# Altium schematic sheet a0206-2006.17.SchDoc
size 558 x 431 mm
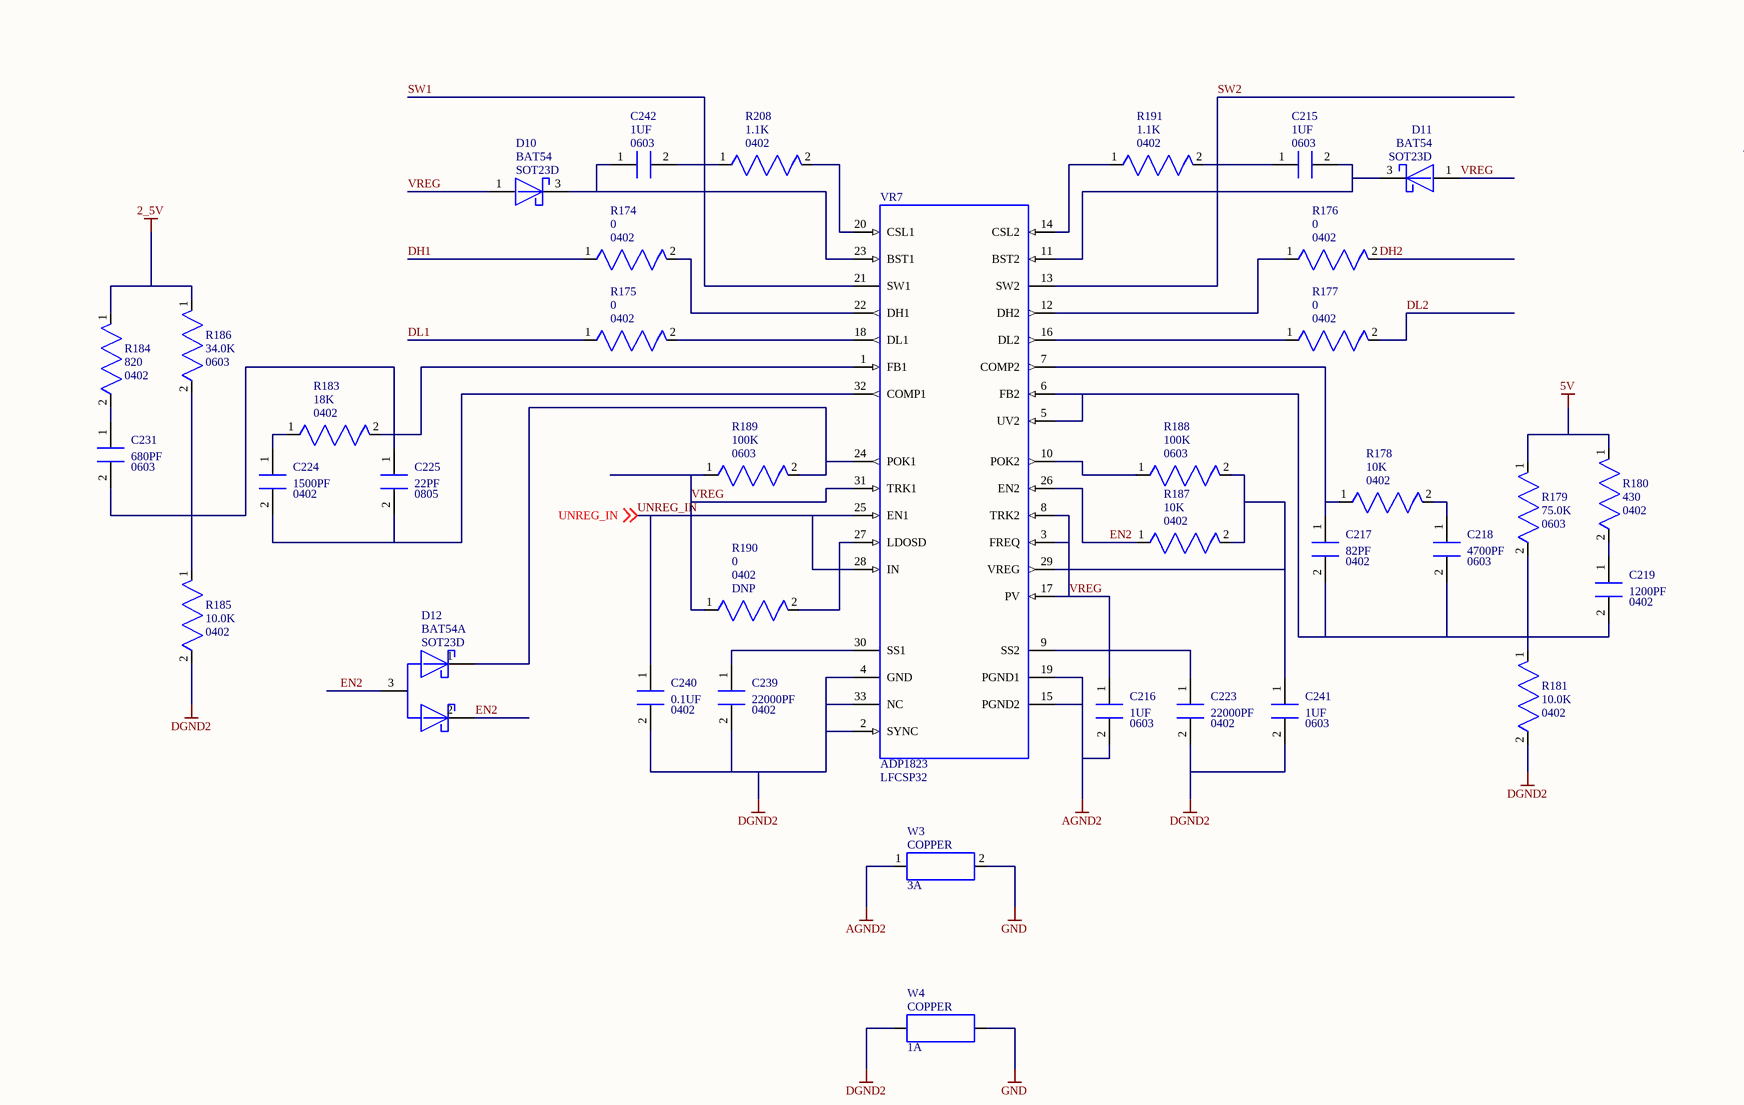
[diagram p0: a0206-2006.17.SchDoc, top left]
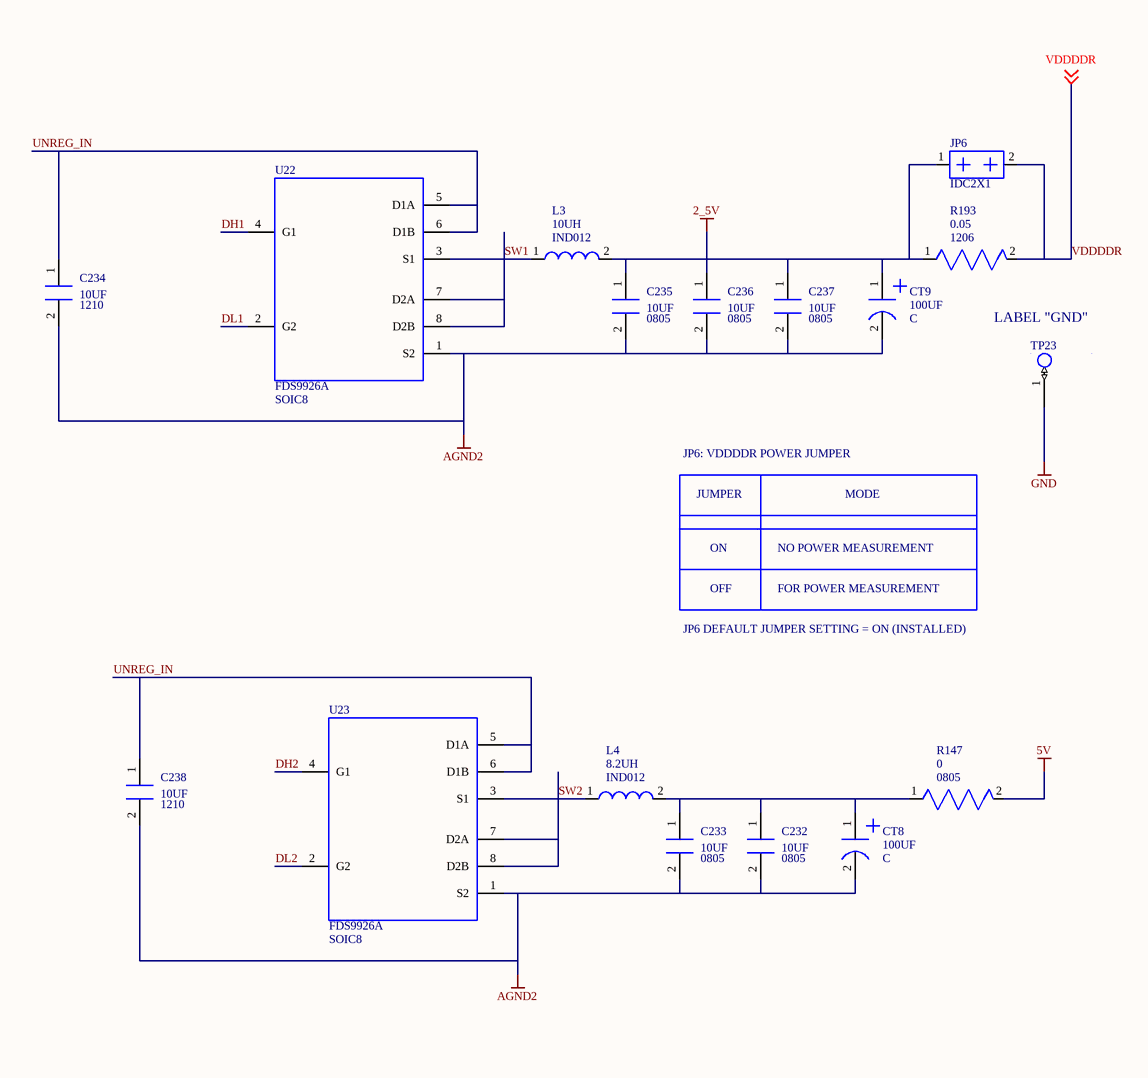
[diagram p1: a0206-2006.17.SchDoc, top right]
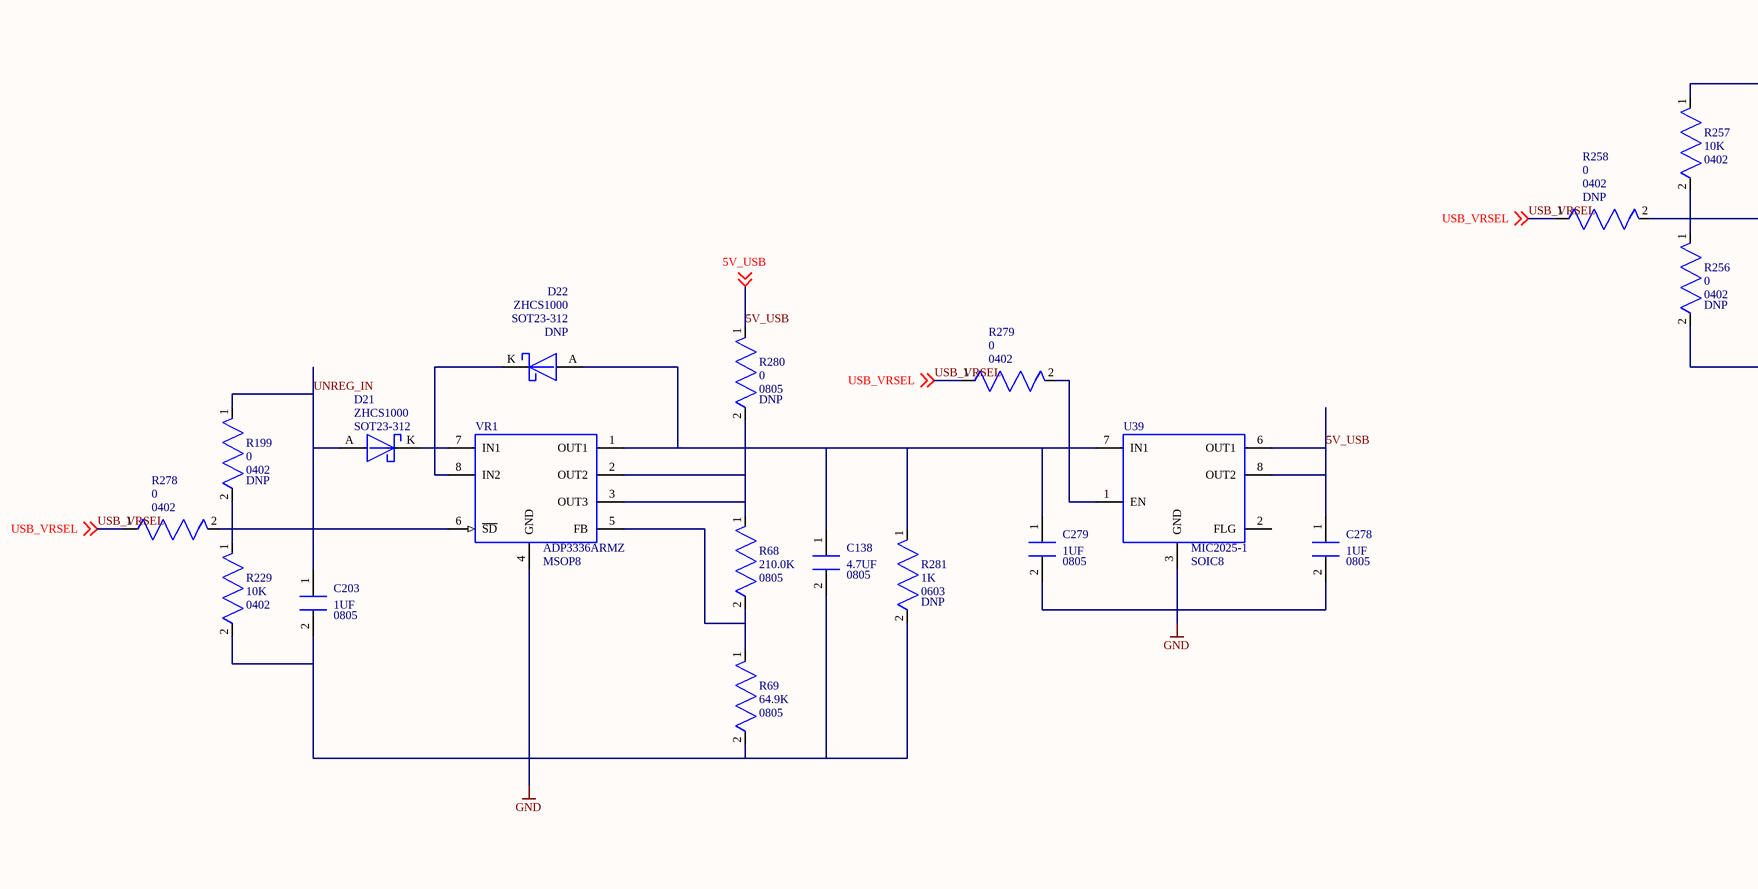
[diagram p2: a0206-2006.17.SchDoc, bottom left]
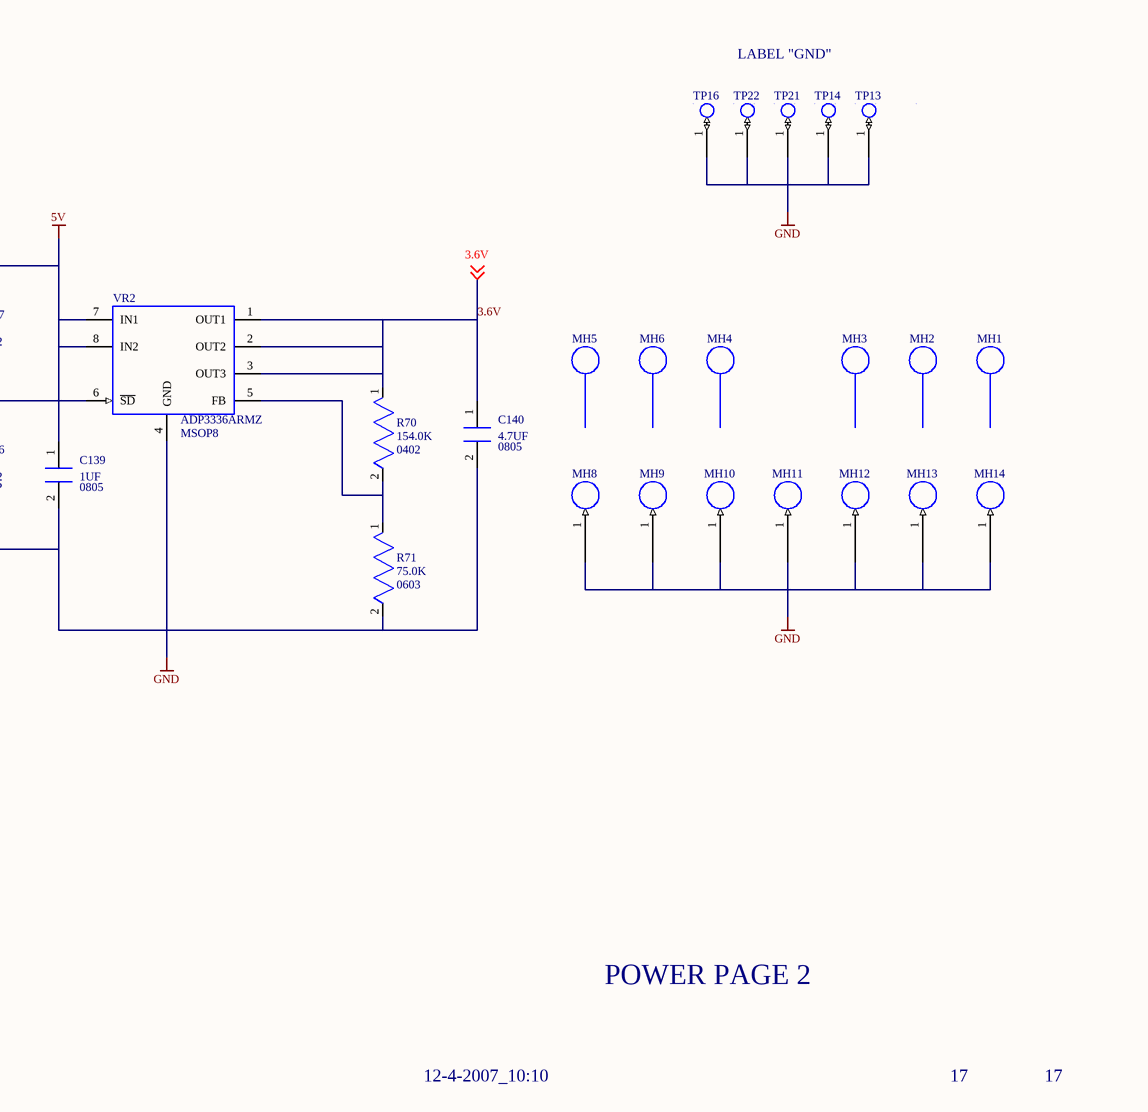
[diagram p3: a0206-2006.17.SchDoc, bottom right]

## Parts
C138  value 4.7UF  [0805]  (hidden comment: *)
C139  value 1UF  [0805]  (hidden comment: *)
C140  value 4.7UF  [0805]  (hidden comment: *)
C203  value 1UF  [0805]  (hidden comment: *)
C215  value 1UF  [0603]  (hidden comment: *)
C216  value 1UF  [0603]  (hidden comment: *)
C217  value 82PF  [0402]  (hidden comment: *)
C218  value 4700PF  [0603]  (hidden comment: *)
C219  value 1200PF  [0402]  (hidden comment: *)
C223  value 22000PF  [0402]  (hidden comment: *)
C224  value 1500PF  [0402]  (hidden comment: *)
C225  value 22PF  [0805]  (hidden comment: *)
C231  value 680PF  [0603]  (hidden comment: *)
C232  value 10UF  [0805]  (hidden comment: *)
C233  value 10UF  [0805]  (hidden comment: *)
C234  value 10UF  [1210]  (hidden comment: *)
C235  value 10UF  [0805]  (hidden comment: *)
C236  value 10UF  [0805]  (hidden comment: *)
C237  value 10UF  [0805]  (hidden comment: *)
C238  value 10UF  [1210]  (hidden comment: *)
C239  value 22000PF  [0402]  (hidden comment: *)
C240  value 0.1UF  [0402]  (hidden comment: *)
C241  value 1UF  [0603]  (hidden comment: *)
C242  value 1UF  [0603]  (hidden comment: *)
C278  value 1UF  [0805]  (hidden comment: *)
C279  value 1UF  [0805]  (hidden comment: *)
CT8  value 100UF  [C]  (hidden comment: *)
CT9  value 100UF  [C]  (hidden comment: *)
D10  PART: BAT54  [SOT23D]  (hidden comment: *)
D11  PART: BAT54  [SOT23D]  (hidden comment: *)
D12  PART: BAT54A  [SOT23D]  (hidden comment: *)
D21  PART: ZHCS1000  [SOT23-312]  (hidden comment: *)
D22  PART: ZHCS1000  CLASS: DNP  [SOT23-312]  (hidden comment: *)
JP6  *  [IDC2X1]  (value not drawn)
L3  value 10UH  [IND012]  (hidden comment: *)
L4  value 8.2UH  [IND012]  (hidden comment: *)
MH1  *  [MSC004]  (value not drawn)
MH2  *  [MSC004]  (value not drawn)
MH3  *  [MSC004]  (value not drawn)
MH4  *  [MSC004]  (value not drawn)
MH5  *  [MSC004]  (value not drawn)
MH6  *  [MSC004]  (value not drawn)
MH8  *  [MSC006]  (value not drawn)
MH9  *  [MSC006]  (value not drawn)
MH10  *  [MSC006]  (value not drawn)
MH11  *  [MSC006]  (value not drawn)
MH12  *  [MSC006]  (value not drawn)
MH13  *  [MSC006]  (value not drawn)
MH14  *  [MSC006]  (value not drawn)
R68  value 210.0K  [0805]  (hidden comment: *)
R69  value 64.9K  [0805]  (hidden comment: *)
R70  value 154.0K  [0402]  (hidden comment: *)
R71  value 75.0K  [0603]  (hidden comment: *)
R147  value 0  [0805]  (hidden comment: *)
R174  value 0  [0402]  (hidden comment: *)
R175  value 0  [0402]  (hidden comment: *)
R176  value 0  [0402]  (hidden comment: *)
R177  value 0  [0402]  (hidden comment: *)
R178  value 10K  [0402]  (hidden comment: *)
R179  value 75.0K  [0603]  (hidden comment: *)
R180  value 430  [0402]  (hidden comment: *)
R181  value 10.0K  [0402]  (hidden comment: *)
R183  value 18K  [0402]  (hidden comment: *)
R184  value 820  [0402]  (hidden comment: *)
R185  value 10.0K  [0402]  (hidden comment: *)
R186  value 34.0K  [0603]  (hidden comment: *)
R187  value 10K  [0402]  (hidden comment: *)
R188  value 100K  [0603]  (hidden comment: *)
R189  value 100K  [0603]  (hidden comment: *)
R190  value 0  CLASS: DNP  [0402]  (hidden comment: *)
R191  value 1.1K  [0402]  (hidden comment: *)
R193  value 0.05  [1206]  (hidden comment: *)
R199  value 0  CLASS: DNP  [0402]  (hidden comment: *)
R208  value 1.1K  [0402]  (hidden comment: *)
R229  value 10K  [0402]  (hidden comment: *)
R256  value 0  CLASS: DNP  [0402]  (hidden comment: *)
R257  value 10K  [0402]  (hidden comment: *)
R258  value 0  CLASS: DNP  [0402]  (hidden comment: *)
R278  value 0  [0402]  (hidden comment: *)
R279  value 0  [0402]  (hidden comment: *)
R280  value 0  CLASS: DNP  [0805]  (hidden comment: *)
R281  value 1K  CLASS: DNP  [0603]  (hidden comment: *)
TP13  *  [TP]  (value not drawn)
TP14  *  [TP]  (value not drawn)
TP16  *  [TP]  (value not drawn)
TP21  *  [TP]  (value not drawn)
TP22  *  [TP]  (value not drawn)
TP23  *  [TP]  (value not drawn)
U22  PART: FDS9926A  [SOIC8]  (hidden comment: *)
U23  PART: FDS9926A  [SOIC8]  (hidden comment: *)
U39  PART: MIC2025-1  [SOIC8]  (hidden comment: *)
VR1  PART: ADP3336ARMZ  [MSOP8]  (hidden comment: *)
VR2  PART: ADP3336ARMZ  [MSOP8]  (hidden comment: *)
VR7  PART: ADP1823  [LFCSP32]  (hidden comment: *)
W3  value COPPER  [3A]  (hidden comment: *)
W4  value COPPER  [1A]  (hidden comment: *)

## Nets
2_5V: C235.1(A) C236.1(A) C237.1(A) CT9.1(P) JP6.1 L3.2(B) R184.1(N1) R186.1(N1) R193.1(N1)
5V: C139.1(A) R147.2(N2) R179.1(N1) R180.1(N1) R257.1(N1) VR2.7(IN1) VR2.8(IN2)
AGND2: C216.2(B) C232.2(B) C233.2(B) C234.2(B) C235.2(B) C236.2(B) C237.2(B) C238.2(B) CT8.2(N) CT9.2(N) U22.1(S2) U23.1(S2) VR7.15(PGND2) VR7.19(PGND1) W3.1(N1)
DGND2: C223.2(B) C239.2(B) C240.2(B) C241.2(B) R181.2(N2) R185.2(N2) VR7.2(SYNC) VR7.4(GND) VR7.33(NC) W4.1(N1)
GND: C138.2(B) C139.2(B) C140.2(B) C203.2(B) C278.2(B) C279.2(B) MH8.1(TP) MH9.1(TP) MH10.1(TP) MH11.1(TP) MH12.1(TP) MH13.1(TP) MH14.1(TP) R69.2(N2) R71.2(N2) R229.2(N2) R256.2(N2) R281.2(N2) TP13.1(TP) TP14.1(TP) TP16.1(TP) TP21.1(TP) TP22.1(TP) TP23.1(TP) U39.3(GND) VR1.4(GND) VR2.4(GND) W3.2(N2) W4.2(N2)
3.6V: C140.1(A) R70.1(N1) VR2.1(OUT1) VR2.2(OUT2) VR2.3(OUT3) ; off-sheet 3.6V
5V_USB: C278.1(A) R280.1(N1) U39.6(OUT1) U39.8(OUT2) ; off-sheet 5V_USB
DH1: R174.1(N1) U22.4(G1)
DH2: R176.2(N2) U23.4(G1)
DL1: R175.1(N1) U22.2(G2)
DL2: R177.2(N2) U23.2(G2)
EN2: D12.2(CATHODE_B) D12.3(ANODE) R187.1(N1) VR7.26(EN2)
SW1: C242.2(B) L3.1(A) R208.1(N1) U22.3(S1) U22.7(D2A) U22.8(D2B) VR7.21(SW1)
SW2: C215.1(A) L4.1(A) R191.2(N2) U23.3(S1) U23.7(D2A) U23.8(D2B) VR7.13(SW2)
UNREG_IN: C203.1(A) C234.1(A) C238.1(A) C240.1(A) D21.A(ANODE) R199.1(N1) U22.5(D1A) U22.6(D1B) U23.5(D1A) U23.6(D1B) VR7.25(EN1) VR7.28(IN) ; off-sheet UNREG_IN
USB_VRSEL: R258.1(N1) R278.1(N1) R279.1(N1) ; off-sheet USB_VRSEL
VDDDDR: JP6.2 R193.2(N2) ; off-sheet VDDDDR
VREG: C216.1(A) C241.1(A) D10.1(ANODE) D11.1(ANODE) R187.2(N2) R188.2(N2) R189.1(N1) R190.1(N1) VR7.3(FREQ) VR7.8(TRK2) VR7.17(PV) VR7.29(VREG) VR7.31(TRK1)
NetC138_1: C138.1(A) C279.1(A) D22.A(ANODE) R68.1(N1) R280.2(N2) R281.1(N1) U39.7(IN1) VR1.1(OUT1) VR1.2(OUT2) VR1.3(OUT3)
NetC215_2: C215.2(B) D11.3(CATHODE) VR7.11(BST2)
NetC217_1: C217.1(A) R178.1(N1) VR7.7(COMP2)
NetC217_2: C217.2(B) C218.2(B) C219.2(B) R179.2(N2) R181.1(N1) VR7.5(UV2) VR7.6(FB2)
NetC218_1: C218.1(A) R178.2(N2)
NetC219_1: C219.1(A) R180.2(N2)
NetC223_1: C223.1(A) VR7.9(SS2)
NetC224_1: C224.1(A) R183.1(N1)
NetC224_2: C224.2(B) C225.2(B) VR7.32(COMP1)
NetC225_1: C225.1(A) C231.2(B) R183.2(N2) R185.1(N1) R186.2(N2) VR7.1(FB1)
NetC231_1: C231.1(A) R184.2(N2)
NetC232_1: C232.1(A) C233.1(A) CT8.1(P) L4.2(B) R147.1(N1)
NetC239_1: C239.1(A) VR7.30(SS1)
NetC242_1: C242.1(A) D10.3(CATHODE) VR7.23(BST1)
NetD12_1: D12.1(CATHODE_A) R189.2(N2) VR7.24(POK1)
NetD21_K: D21.K(CATHODE) D22.K(CATHODE) VR1.7(IN1) VR1.8(IN2)
NetR68_2: R68.2(N2) R69.1(N1) VR1.5(FB)
NetR70_2: R70.2(N2) R71.1(N1) VR2.5(FB)
NetR174_2: R174.2(N2) VR7.22(DH1)
NetR175_2: R175.2(N2) VR7.18(DL1)
NetR176_1: R176.1(N1) VR7.12(DH2)
NetR177_1: R177.1(N1) VR7.16(DL2)
NetR188_1: R188.1(N1) VR7.10(POK2)
NetR190_2: R190.2(N2) VR7.27(LDOSD)
NetR191_1: R191.1(N1) VR7.14(CSL2)
NetR199_2: R199.2(N2) R229.1(N1) R278.2(N2) VR1.6(~{SD})
NetR208_2: R208.2(N2) VR7.20(CSL1)
NetR256_1: R256.1(N1) R257.2(N2) R258.2(N2) VR2.6(~{SD})
NetR279_2: R279.2(N2) U39.1(EN)

Not connected (* = marked no-connect by the designer): D10 2; D11 2; MH1 1; MH2 1; MH3 1; MH4 1; MH5 1; MH6 1; U39 2(FLG) 4 5

## Notes on the sheet
- LABEL "GND"
- JP6: VDDDDR POWER JUMPER
- JUMPER
- ON
- NO POWER MEASUREMENT
- MODE
- OFF
- FOR POWER MEASUREMENT
- JP6 DEFAULT JUMPER SETTING = ON (INSTALLED)
- POWER PAGE 2
- 12-4-2007_10:10
- 17
- A
- B
- C
- D
- 1
- 2
- 3
- 20 Cotton Road
- 4
- DEVICES
- ANALOG
- Nashua, NH 03063
- PH: 1-800-ANALOGD
- Title
- ADSP-BF548 EZ-KIT LITE
- Size
- Board No.
- A0206-2006
- Rev
- 1.4B
- Date
- Sheet
- of

## Library data of the parts
C138 = CAP_NON_POLARIZED.2: PART_SPEC: CAPACITOR; LEVEL: STD; PRT_NUM: 7000275; VOLTAGE: 6.3V; TOLERANCE: 10%; TYPE: X5R; PKG_TYPE: 0805; ROHS: ROHS
C139 C278 = CAP_NON_POLARIZED.2: PART_SPEC: CAPACITOR; LEVEL: STD; TYPE: X7R; TOLERANCE: 10%; VOLTAGE: 16V; PRT_NUM: 7000143; PKG_TYPE: 0805; ROHS: ROHS
C140 = CAP_NON_POLARIZED.2: PART_SPEC: CAPACITOR; LEVEL: STD; TYPE: X5R; TOLERANCE: 10%; VOLTAGE: 6.3V; PRT_NUM: 7000275; PKG_TYPE: 0805; ROHS: ROHS
C203 C279 = CAP_NON_POLARIZED.2: PART_SPEC: CAPACITOR; LEVEL: STD; PRT_NUM: 7000143; VOLTAGE: 16V; TOLERANCE: 10%; TYPE: X7R; PKG_TYPE: 0805; ROHS: ROHS
C215 C242 = CAP_NON_POLARIZED.1: PART_SPEC: CAPACITOR; LEVEL: STD; PRT_NUM: 7000344; TYPE: X5R; VOLTAGE: 16V; TOLERANCE: 10%; PKG_TYPE: 0603; ROHS: ROHS
C216 = CAP_NON_POLARIZED.2: PART_SPEC: CAPACITOR; LEVEL: STD; TOLERANCE: 10%; VOLTAGE: 16V; TYPE: X5R; PRT_NUM: 7000344; PKG_TYPE: 0603; ROHS: ROHS
C217 = CAP_NON_POLARIZED.2: PART_SPEC: CAPACITOR; LEVEL: STD; PRT_NUM: 7000548; TYPE: NPO; VOLTAGE: 50V; TOLERANCE: 5%; PKG_TYPE: 0402; ROHS: ROHS
C218 = CAP_NON_POLARIZED.2: PART_SPEC: CAPACITOR; LEVEL: STD; PRT_NUM: 7000387; TYPE: X7R; VOLTAGE: 16V; TOLERANCE: 10%; PKG_TYPE: 0603; ROHS: ROHS
C219 = CAP_NON_POLARIZED.2: PART_SPEC: CAPACITOR; LEVEL: STD; PRT_NUM: 7000546; TYPE: X7R; VOLTAGE: 50V; TOLERANCE: 10%; PKG_TYPE: 0402; ROHS: ROHS
C223 C239 = CAP_NON_POLARIZED.2: PART_SPEC: CAPACITOR; LEVEL: STD; PRT_NUM: 7000549; TYPE: X7R; VOLTAGE: 25V; TOLERANCE: 10%; PKG_TYPE: 0402; ROHS: ROHS
C224 = CAP_NON_POLARIZED.2: PART_SPEC: CAPACITOR; LEVEL: STD; PRT_NUM: 7000550; TYPE: X7R; VOLTAGE: 50V; TOLERANCE: 10%; PKG_TYPE: 0402; ROHS: ROHS
C225 = CAP_NON_POLARIZED.2: PART_SPEC: CAPACITOR; LEVEL: STD; PRT_NUM: 7000028; TYPE: NPO; VOLTAGE: 50V; TOLERANCE: 5%; PKG_TYPE: 0805; ROHS: ROHS
C231 = CAP_NON_POLARIZED.2: PART_SPEC: CAPACITOR; LEVEL: STD; PRT_NUM: 7000413; TYPE: NPO; VOLTAGE: 50V; TOLERANCE: 5%; PKG_TYPE: 0603; ROHS: ROHS
C232 C236 = CAP_NON_POLARIZED.2: PART_SPEC: CAPACITOR; LEVEL: STD; TOLERANCE: 10%; VOLTAGE: 6.3V; TYPE: X5R; PRT_NUM: 7000265; PKG_TYPE: 0805; ROHS: ROHS
C233 C235 C237 = CAP_NON_POLARIZED.2: PART_SPEC: CAPACITOR; LEVEL: STD; PRT_NUM: 7000265; TYPE: X5R; VOLTAGE: 6.3V; TOLERANCE: 10%; PKG_TYPE: 0805; ROHS: ROHS
C234 = CAP_NON_POLARIZED.2: PART_SPEC: CAPACITOR; LEVEL: STD; PRT_NUM: 7000492; TYPE: X5R; VOLTAGE: 16V; TOLERANCE: 10%; PKG_TYPE: 1210; ROHS: ROHS
C238 = CAP_NON_POLARIZED.2: PART_SPEC: CAPACITOR; LEVEL: STD; TOLERANCE: 10%; VOLTAGE: 16V; TYPE: X5R; PRT_NUM: 7000492; PKG_TYPE: 1210; ROHS: ROHS
C240 = CAP_NON_POLARIZED.2: PART_SPEC: CAPACITOR; LEVEL: STD; PRT_NUM: 7000278; TYPE: X5R; VOLTAGE: 10V; TOLERANCE: 10%; PKG_TYPE: 0402; ROHS: ROHS
C241 = CAP_NON_POLARIZED.2: PART_SPEC: CAPACITOR; LEVEL: STD; PRT_NUM: 7000344; TYPE: X5R; VOLTAGE: 16V; TOLERANCE: 10%; PKG_TYPE: 0603; ROHS: ROHS
CT8 = CAP_POLARIZED.3: PART_SPEC: CAPACITOR; LEVEL: STD; PRT_NUM: 7000303; VOLTAGE: 10V; TOLERANCE: 10%; PKG_TYPE: C; TYPE: TANT-LOW-ESR; ROHS: ROHS
CT9 = CAP_POLARIZED.3: PART_SPEC: CAPACITOR; LEVEL: STD; TOLERANCE: 10%; VOLTAGE: 10V; PRT_NUM: 7000303; PKG_TYPE: C; ROHS: ROHS; TYPE: TANT-LOW-ESR
D10 D11 = DIO_SCHOTTYKY_BAT54.1: SCHOTTKY 30V SINGLE; LEVEL: STD; CURRENT: 200MA; NC: 2; PRT_NUM: 7000534; PKG_TYPE: SOT23D; ROHS: ROHS; WEB: http://www.fairchildsemi.com/pf/BA/BAT54.html
D12 = DIO_SCHOTTYKY_BAT54A.1: SCHOTTKY 30V DUAL; LEVEL: STD; CURRENT: 200MA; PRT_NUM: 7000533; PKG_TYPE: SOT23D; ROHS: ROHS; WEB: http://www.fairchildsemi.com/pf/BA/BAT54A.html
D21 D22 = DIO_SCHOTTKY_3.3: SCHOTTKY; LEVEL: STD; CURRENT: 1A; PRT_NUM: 7000252; PKG_TYPE: SOT23-312; WEB: http://www.zetex.com/3.0/3-3-3.asp?pn; ROHS: ROHS
JP6 = CON_2X1.2: HEADER; PART_SPEC: CONNECTOR; LEVEL: STD; PRT_NUM: 6000774; CONFIGURATION: 2X1; PKG_TYPE: IDC2X1; TYPE: IDC; ROHS: ROHS
L3 = IND_STANDARD.1: PART_SPEC: INDUCTOR; LEVEL: STD; PRT_NUM: 7000536; TOLERANCE: 20%; PKG_TYPE: IND012; ROHS: ROHS
L4 = IND_STANDARD.1: PART_SPEC: INDUCTOR; LEVEL: STD; PRT_NUM: 7000535; TOLERANCE: 20%; PKG_TYPE: IND012; ROHS: ROHS
MH1-MH6 = MSC_MOUNTING_HOLE_NC.1: MOUNTING HOLE; NC: 1; CLASS: DNP; LEVEL: STD; ROHS: ROHS; PART: HOLE; PART_SPEC: HOLE; PKG_TYPE: MSC004
MH8-MH14 = MSC_MOUNTING_HOLE.1: MOUNTING HOLE; CLASS: DNP; LEVEL: STD; ROHS: ROHS; PART: HOLE; PART_SPEC: HOLE; PKG_TYPE: MSC006
R68 = RES_STANDARD.2: PART_SPEC: RESISTOR; LEVEL: STD; TOLERANCE: 1%; PRT_NUM: 7000311; POWER: 1/4W; PKG_TYPE: 0805; ROHS: ROHS
R69 = RES_STANDARD.2: PART_SPEC: RESISTOR; LEVEL: STD; TOLERANCE: 1%; PRT_NUM: 7000309; POWER: 1/10W; PKG_TYPE: 0805; ROHS: ROHS
R70 = RES_STANDARD.2: PART_SPEC: RESISTOR; LEVEL: STD; POWER: 1/16W; PRT_NUM: 7000576; TOLERANCE: 1%; PKG_TYPE: 0402; ROHS: ROHS
R71 = RES_STANDARD.2: PART_SPEC: RESISTOR; LEVEL: STD; POWER: 1/16W; PRT_NUM: 7000378; TOLERANCE: 1%; PKG_TYPE: 0603; ROHS: ROHS
R147 = RES_STANDARD.1: PART_SPEC: RESISTOR; LEVEL: STD; PRT_NUM: 7000228; POWER: 1/10W; TOLERANCE: 5%; PKG_TYPE: 0805; ROHS: ROHS
R174-R177 R278 = RES_STANDARD.1: PART_SPEC: RESISTOR; LEVEL: STD; PRT_NUM: 7000282; POWER: 1/16W; TOLERANCE: 5%; PKG_TYPE: 0402; ROHS: ROHS
R178 R187 = RES_STANDARD.1: PART_SPEC: RESISTOR; LEVEL: STD; PRT_NUM: 7000280; POWER: 1/16W; TOLERANCE: 5%; PKG_TYPE: 0402; ROHS: ROHS
R179 = RES_STANDARD.2: PART_SPEC: RESISTOR; LEVEL: STD; PRT_NUM: 7000378; POWER: 1/16W; TOLERANCE: 1%; PKG_TYPE: 0603; ROHS: ROHS
R180 = RES_STANDARD.2: PART_SPEC: RESISTOR; LEVEL: STD; PRT_NUM: 7000544; POWER: 1/16W; TOLERANCE: 1%; PKG_TYPE: 0402; ROHS: ROHS
R181 R185 = RES_STANDARD.2: PART_SPEC: RESISTOR; LEVEL: STD; PRT_NUM: 7000582; POWER: 1/16W; TOLERANCE: 1%; PKG_TYPE: 0402; ROHS: ROHS
R183 = RES_STANDARD.1: PART_SPEC: RESISTOR; LEVEL: STD; PRT_NUM: 7000539; POWER: 1/16W; TOLERANCE: 5%; PKG_TYPE: 0402; ROHS: ROHS
R184 = RES_STANDARD.2: PART_SPEC: RESISTOR; LEVEL: STD; PRT_NUM: 7000542; POWER: 1/16W; TOLERANCE: 5%; PKG_TYPE: 0402; ROHS: ROHS
R186 = RES_STANDARD.2: PART_SPEC: RESISTOR; LEVEL: STD; PRT_NUM: 7000609; POWER: 1/10W; TOLERANCE: 1%; PKG_TYPE: 0603; ROHS: ROHS
R188 = RES_STANDARD.1: PART_SPEC: RESISTOR; LEVEL: STD; TOLERANCE: 5%; POWER: 1/10W; PRT_NUM: 7000367; PKG_TYPE: 0603; ROHS: ROHS
R189 = RES_STANDARD.1: PART_SPEC: RESISTOR; LEVEL: STD; PRT_NUM: 7000367; POWER: 1/10W; TOLERANCE: 5%; PKG_TYPE: 0603; ROHS: ROHS
R190 R258 R279 = RES_STANDARD.1: PART_SPEC: RESISTOR; LEVEL: STD; TOLERANCE: 5%; POWER: 1/16W; PRT_NUM: 7000282; PKG_TYPE: 0402; ROHS: ROHS
R191 R208 = RES_STANDARD.1: PART_SPEC: RESISTOR; LEVEL: STD; PRT_NUM: 7000538; POWER: 1/16W; TOLERANCE: 1%; PKG_TYPE: 0402; ROHS: ROHS
R193 = RES_STANDARD.1: PART_SPEC: RESISTOR; LEVEL: STD; TOLERANCE: 1%; POWER: 1/2W; PRT_NUM: 7000486; PKG_TYPE: 1206; ROHS: ROHS
R199 = RES_STANDARD.2: PART_SPEC: RESISTOR; LEVEL: STD; TOLERANCE: 5%; POWER: 1/16W; PRT_NUM: 7000282; PKG_TYPE: 0402; ROHS: ROHS
R229 = RES_STANDARD.2: PART_SPEC: RESISTOR; LEVEL: STD; PRT_NUM: 7000280; POWER: 1/16W; TOLERANCE: 5%; PKG_TYPE: 0402; ROHS: ROHS
R256 = RES_STANDARD.2: PART_SPEC: RESISTOR; LEVEL: STD; PRT_NUM: 7000282; POWER: 1/16W; TOLERANCE: 5%; PKG_TYPE: 0402; ROHS: ROHS
R257 = RES_STANDARD.2: PART_SPEC: RESISTOR; LEVEL: STD; TOLERANCE: 5%; POWER: 1/16W; PRT_NUM: 7000280; PKG_TYPE: 0402; ROHS: ROHS
R280 = RES_STANDARD.2: PART_SPEC: RESISTOR; LEVEL: STD; PRT_NUM: 7000228; POWER: 1/10W; TOLERANCE: 5%; PKG_TYPE: 0805; ROHS: ROHS
R281 = RES_STANDARD.2: PART_SPEC: RESISTOR; LEVEL: STD; POWER: 1/10W; PRT_NUM: 7000384; TOLERANCE: 5%; PKG_TYPE: 0603; ROHS: ROHS
TP13 TP14 TP16 TP21-TP23 = MSC_TEST_POINT.1: TESTPOINT; CLASS: DNP; LEVEL: STD; BOARDS: BOTH; PART_SPEC: TESTPOINT; PART: TESTPOINT; ROHS: ROHS; PKG_TYPE: TP
U22 U23 = ICS_FDS9926A.1: 2.5V DUAL N-MOSFETS; LEVEL: STD; PRT_NUM: 1000413; WEB: http://www.fairchildsemi.com/pf/FD/FDS9926A.html; PKG_TYPE: SOIC8; ROHS: ROHS
U39 = ICS_MIC2025.1: PWR DIST MOSFET 0.5A; LEVEL: STD; NC: 4,5; PRT_NUM: 1000443; WEB: http://www.micrel.com/_PDF/mic2025.pdf; PKG_TYPE: SOIC8; ROHS: ROHS
VR1 VR2 = ICS_ADP3336.1: ADJ 500MA REGULATOR; LEVEL: STD; PRT_NUM: 30-025190-01; PKG_TYPE: MSOP8; WEB: HTTP://WWW.ANALOG.COM/EN/PROD/0%2C2877%2CADP3336%2C00.HTML; ROHS: ROHS
VR7 = ICS_ADP1823.1: DUAL STEPDOWN CONTROLLER; LEVEL: STD; PRT_NUM: 30-025759-01; WEB: http://www.analog.com/en/prod/0,2877,ADP1823,00.html; PKG_TYPE: LFCSP32; ROHS: ROHS
W3 W4 = MSC_COPPER.1: LEVEL: STD; CLASS: DNP
  W3: PKG_TYPE: 3A
  W4: PKG_TYPE: 1A